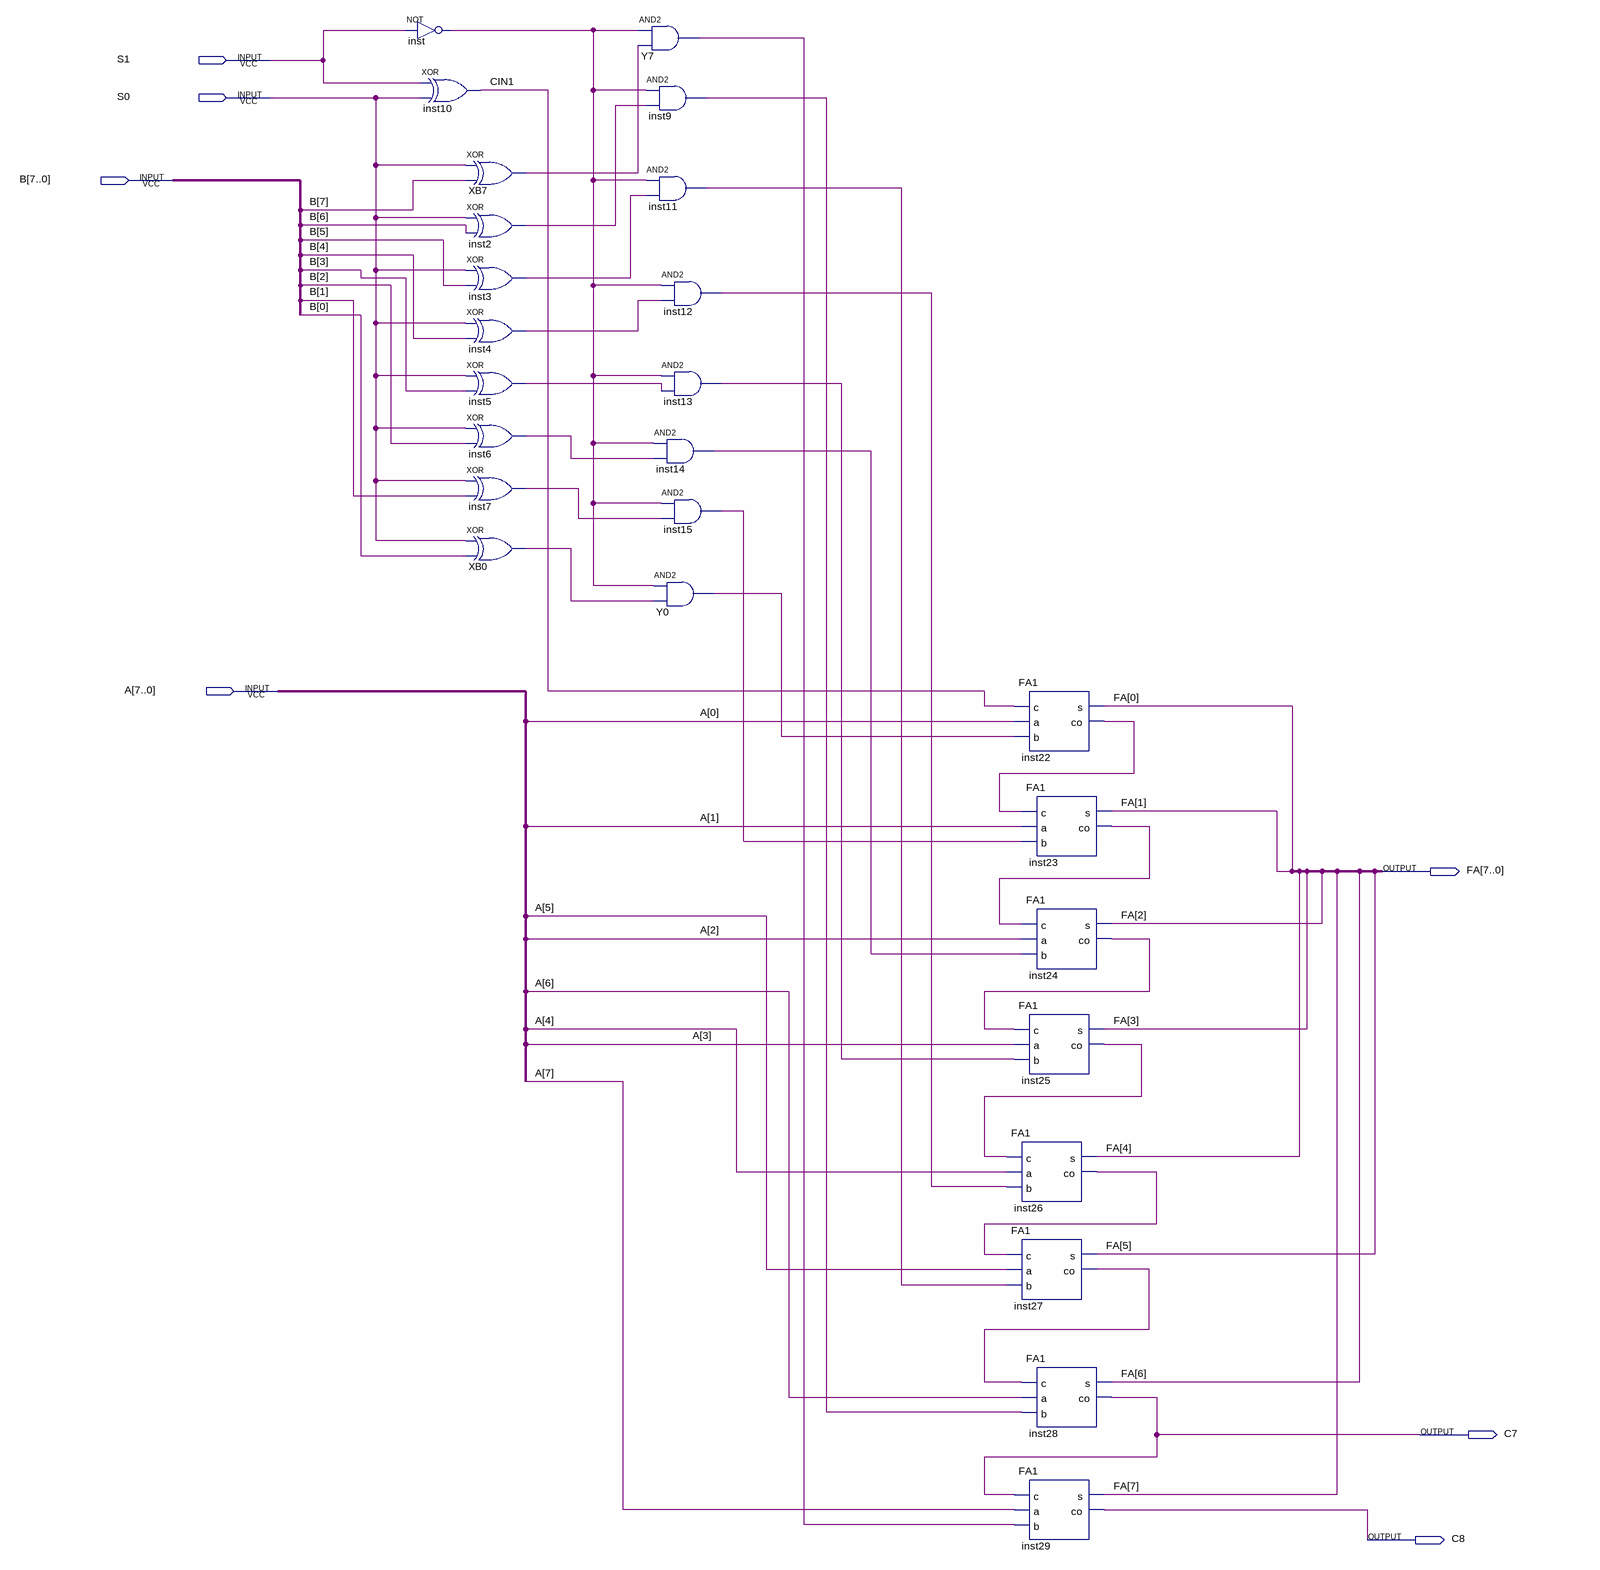
[diagram p0: schematic sheet]
// Quartus schematic alu.bdf as structural Verilog: 26 symbols, 7 pins
module alu (
  input  S1,
  input  S0,
  input  [7:0] B,
  input  [7:0] A,
  output [7:0] FA,
  output C7,
  output C8
);

  wire CIN1, inst2_out, inst3_out, inst4_out, inst5_out, inst6_out, inst7_out, inst9_out, inst11_out,
       inst12_out, inst13_out, inst14_out, inst15_out, inst22_co, inst23_co, inst24_co, inst25_co, inst26_co,
       inst27_co, inst_out, XB0_out, XB7_out, Y0_out, Y7_out;

  not inst (inst_out, S1);
  xor inst10 (CIN1, S1, S0);
  xor XB7 (XB7_out, S0, B[7]);
  xor inst2 (inst2_out, S0, B[6]);
  xor inst3 (inst3_out, S0, B[5]);
  xor inst4 (inst4_out, S0, B[4]);
  xor inst5 (inst5_out, S0, B[3]);
  xor inst6 (inst6_out, S0, B[2]);
  xor inst7 (inst7_out, S0, B[1]);
  xor XB0 (XB0_out, S0, B[0]);
  and Y7 (Y7_out, inst_out, XB7_out);
  and inst9 (inst9_out, inst_out, inst2_out);
  and inst11 (inst11_out, inst_out, inst3_out);
  and inst12 (inst12_out, inst_out, inst4_out);
  and inst13 (inst13_out, inst_out, inst5_out);
  and inst14 (inst14_out, inst_out, inst6_out);
  and inst15 (inst15_out, inst_out, inst7_out);
  and Y0 (Y0_out, inst_out, XB0_out);
  FA1 inst26 (.c(inst25_co), .a(A[4]), .b(inst12_out), .s(FA[4]), .co(inst26_co));
  FA1 inst27 (.c(inst26_co), .a(A[5]), .b(inst11_out), .s(FA[5]), .co(inst27_co));
  FA1 inst22 (.c(CIN1), .a(A[0]), .b(Y0_out), .s(FA[0]), .co(inst22_co));
  FA1 inst23 (.c(inst22_co), .a(A[1]), .b(inst15_out), .s(FA[1]), .co(inst23_co));
  FA1 inst24 (.c(inst23_co), .a(A[2]), .b(inst14_out), .s(FA[2]), .co(inst24_co));
  FA1 inst25 (.c(inst24_co), .a(A[3]), .b(inst13_out), .s(FA[3]), .co(inst25_co));
  FA1 inst28 (.c(inst27_co), .a(A[6]), .b(inst9_out), .s(FA[6]), .co(C7));
  FA1 inst29 (.c(C7), .a(A[7]), .b(Y7_out), .s(FA[7]), .co(C8));
endmodule
